# Altium schematic sheet 08 TypeC USB DP.SchDoc
size A3; Revision: V1.2; SheetNumber: 8; SheetTotal: 11
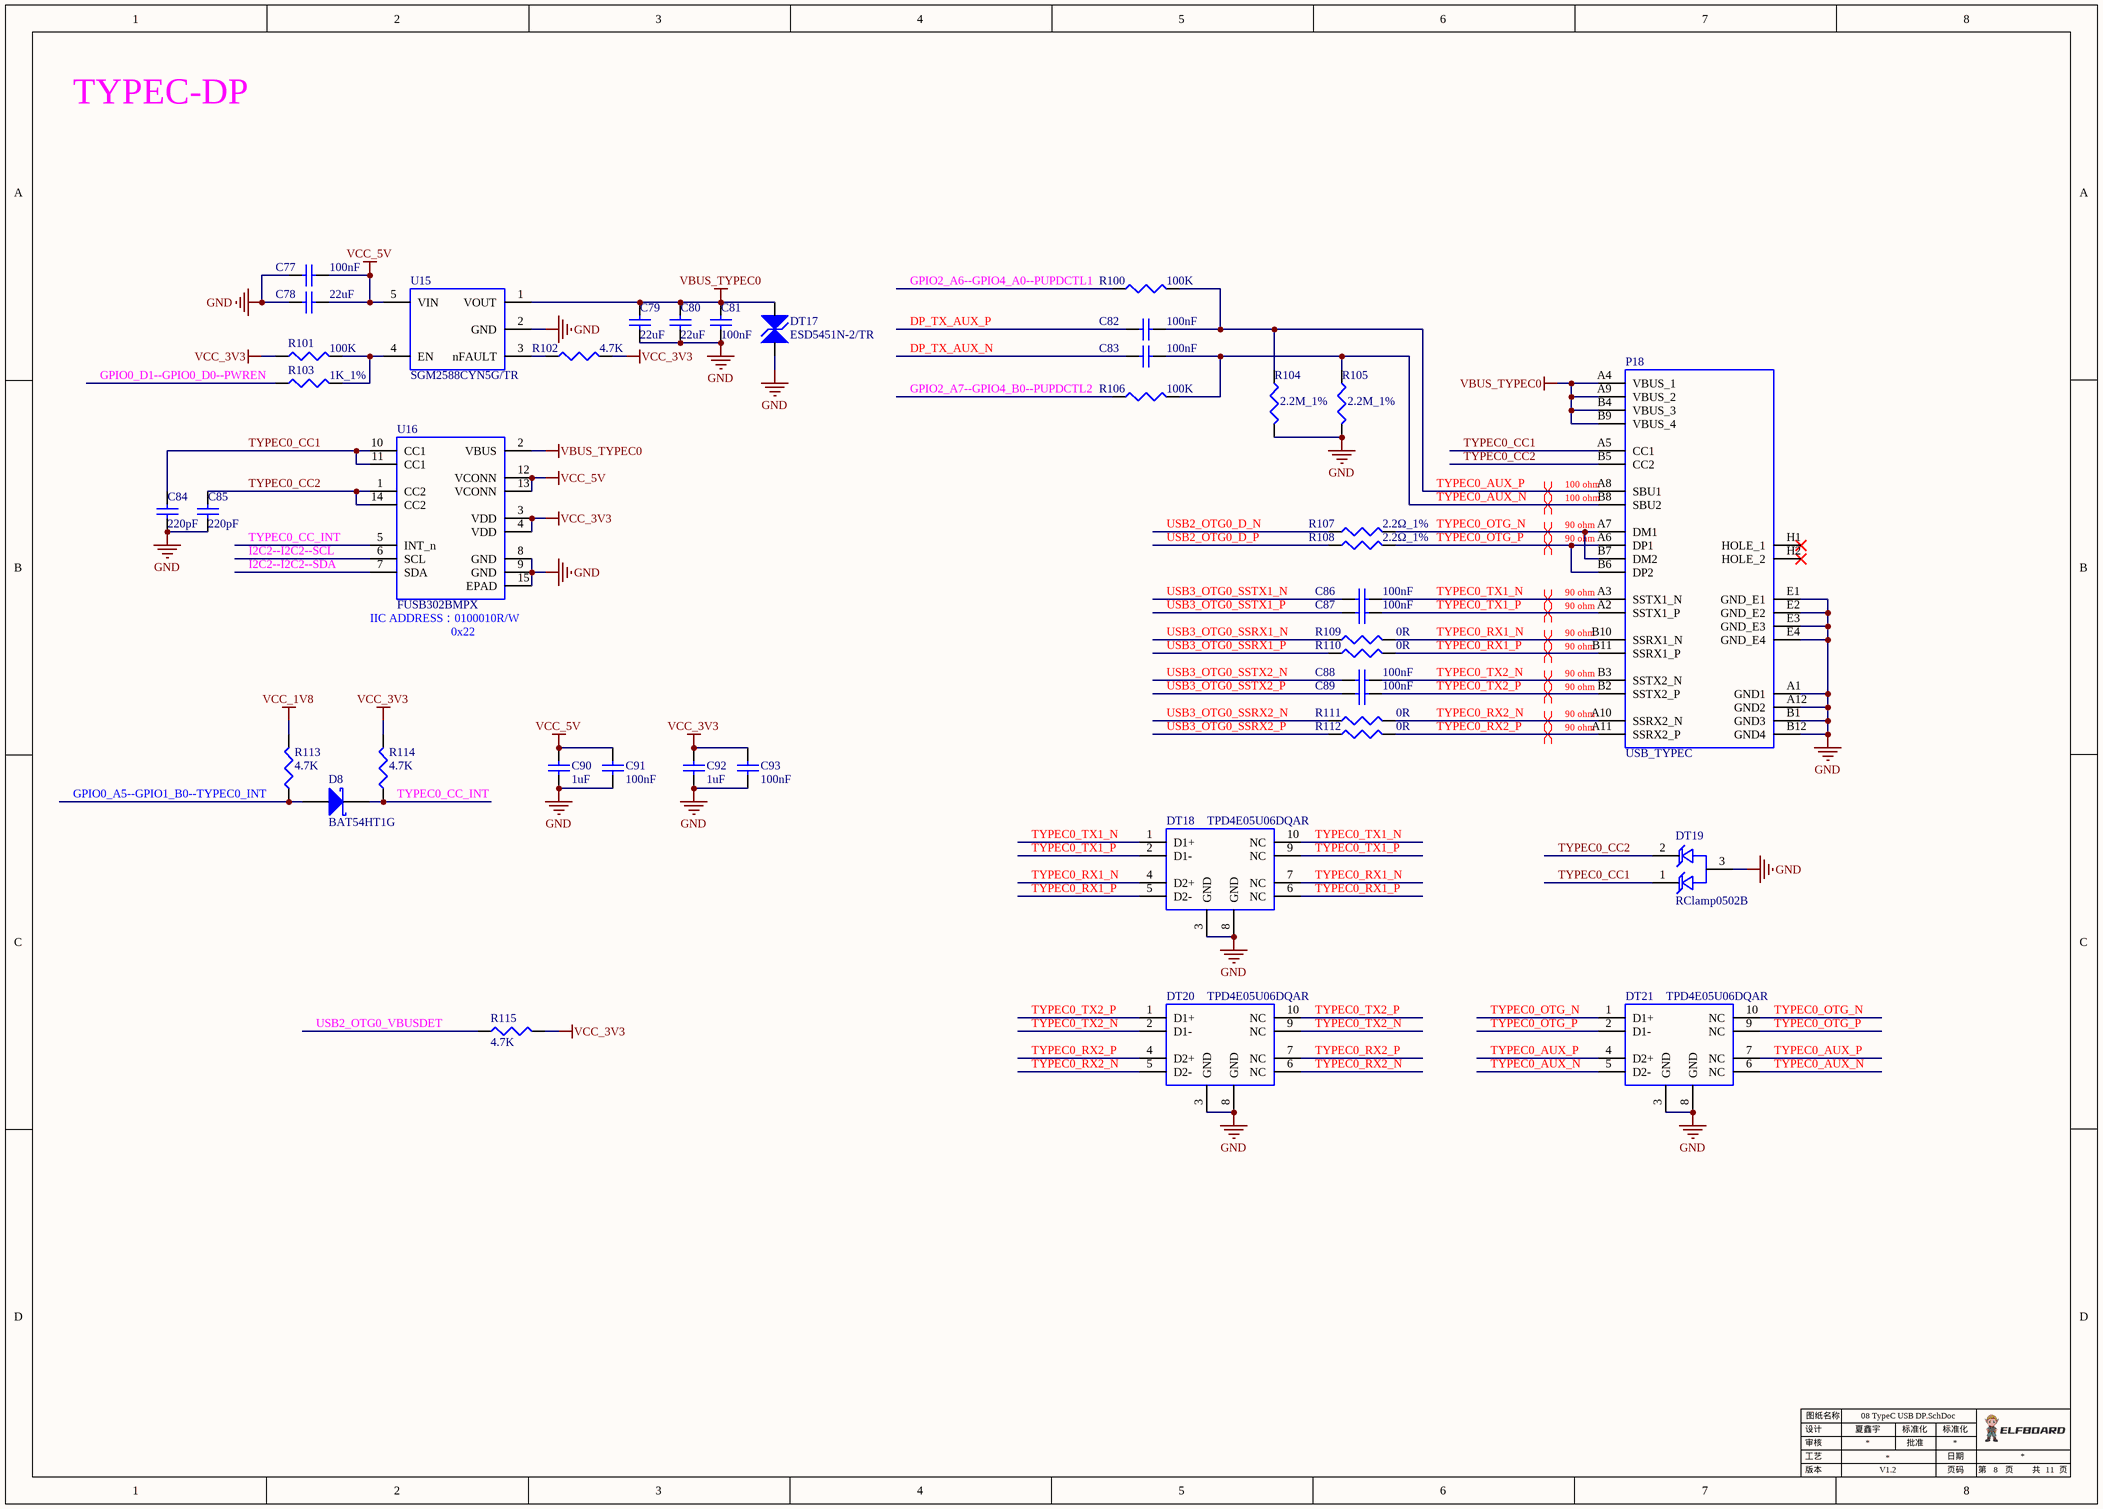
[diagram p0: 08 TypeC USB DP.SchDoc]

## Parts
C77  100nF  [0402C]
C78  22uF  [0805C]
C79  22uF  [0805C]
C80  22uF  [0805C]
C81  100nF  [0402C]
C82  100nF  [0201C]
C83  100nF  [0201C]
C84  220pF  [0402C]
C85  220pF  [0402C]
C86  100nF  [0201C]
C87  100nF  [0201C]
C88  100nF  [0201C]
C89  100nF  [0201C]
C90  1uF  [0402C]
C91  100nF  [0402C]
C92  1uF  [0402C]
C93  100nF  [0402C]
D8  BAT54HT1G  [SOD_323]
DT17  ESD5451N-2/TR  [0402TVS]
DT18  TPD4E05U06DQAR  [USON-10]
DT19  RClamp0502B  [SOT_523]
DT20  TPD4E05U06DQAR  [USON-10]
DT21  TPD4E05U06DQAR  [USON-10]
P18  USB_TYPEC  [USB_TYPEC_SMT]
R100  100K  [0402R]
R101  100K  [0402R]
R102  4.7K  [0402R]
R103  1K_1%  [0402R]
R104  2.2M_1%  [0201R]
R105  2.2M_1%  [0201R]
R106  100K  [0402R]
R107  2.2Ω_1%  [0402R]
R108  2.2Ω_1%  [0402R]
R109  0R  [0201R]
R110  0R  [0201R]
R111  0R  [0201R]
R112  0R  [0201R]
R113  4.7K  [0402R]
R114  4.7K  [0402R]
R115  4.7K  [0402R]
U15  SGM2588CYN5G/TR  [SOT_235]
U16  FUSB302BMPX  [WQFN14_0.5_2.5x2.5]

## Nets
GND: C77.2 C78.2 C79.1 C80.1 C81.1 C84.2 C85.2 C90.1 C91.1 C92.1 C93.1 DT17.1 DT18.3(GND) DT18.8(GND) DT19.3 DT20.3(GND) DT20.8(GND) DT21.3(GND) DT21.8(GND) P18.A1(GND1) P18.A12(GND2) P18.B1(GND3) P18.B12(GND4) P18.E1(GND_E1) P18.E2(GND_E2) P18.E3(GND_E3) P18.E4(GND_E4) R104.2 R105.2 U15.2(GND) U16.8(GND) U16.9(GND) U16.15(EPAD)
VBUS_TYPEC0: C79.2 C80.2 C81.2 DT17.2 P18.A4(VBUS_1) P18.A9(VBUS_2) P18.B4(VBUS_3) P18.B9(VBUS_4) U15.1(VOUT) U16.2(VBUS)
VCC_1V8: R113.2
VCC_3V3: C92.2 C93.2 R101.1 R102.2 R114.2 R115.2 U16.3(VDD) U16.4(VDD)
VCC_5V: C77.1 C78.1 C90.2 C91.2 U15.5(VIN) U16.12(VCONN) U16.13(VCONN)
DP_TX_AUX_N: C83.1
DP_TX_AUX_P: C82.1
GPIO0_A5--GPIO1_B0--TYPEC0_INT: D8.1(A) R113.1
GPIO0_D1--GPIO0_D0--PWREN: R103.1
GPIO2_A6--GPIO4_A0--PUPDCTL1: R100.1
GPIO2_A7--GPIO4_B0--PUPDCTL2: R106.1
I2C2--I2C2--SCL: U16.6(SCL)
I2C2--I2C2--SDA: U16.7(SDA)
TYPEC0_AUX_N: C83.2 DT21.5(D2-) DT21.6(NC) P18.B8(SBU2) R105.1 R106.2
TYPEC0_AUX_P: C82.2 DT21.4(D2+) DT21.7(NC) P18.A8(SBU1) R100.2 R104.1
TYPEC0_CC1: C84.1 DT19.1 P18.A5(CC1) U16.10(CC1) U16.11(CC1)
TYPEC0_CC2: C85.1 DT19.2 P18.B5(CC2) U16.1(CC2) U16.14(CC2)
TYPEC0_CC_INT: D8.2(K) R114.1 U16.5(INT_n)
TYPEC0_OTG_N: DT21.1(D1+) DT21.10(NC) P18.A7(DM1) P18.B7(DM2) R107.2
TYPEC0_OTG_P: DT21.2(D1-) DT21.9(NC) P18.A6(DP1) P18.B6(DP2) R108.2
TYPEC0_RX1_N: DT18.4(D2+) DT18.7(NC) P18.B10(SSRX1_N) R109.2
TYPEC0_RX1_P: DT18.5(D2-) DT18.6(NC) P18.B11(SSRX1_P) R110.2
TYPEC0_RX2_N: DT20.5(D2-) DT20.6(NC) P18.A10(SSRX2_N) R111.2
TYPEC0_RX2_P: DT20.4(D2+) DT20.7(NC) P18.A11(SSRX2_P) R112.2
TYPEC0_TX1_N: C86.2 DT18.1(D1+) DT18.10(NC) P18.A3(SSTX1_N)
TYPEC0_TX1_P: C87.2 DT18.2(D1-) DT18.9(NC) P18.A2(SSTX1_P)
TYPEC0_TX2_N: C88.2 DT20.2(D1-) DT20.9(NC) P18.B3(SSTX2_N)
TYPEC0_TX2_P: C89.2 DT20.1(D1+) DT20.10(NC) P18.B2(SSTX2_P)
USB2_OTG0_D_N: R107.1
USB2_OTG0_D_P: R108.1
USB2_OTG0_VBUSDET: R115.1
USB3_OTG0_SSRX1_N: R109.1
USB3_OTG0_SSRX1_P: R110.1
USB3_OTG0_SSRX2_N: R111.1
USB3_OTG0_SSRX2_P: R112.1
USB3_OTG0_SSTX1_N: C86.1
USB3_OTG0_SSTX1_P: C87.1
USB3_OTG0_SSTX2_N: C88.1
USB3_OTG0_SSTX2_P: C89.1
NetR101_2: R101.2 R103.2 U15.4(EN)
NetR102_1: R102.1 U15.3(nFAULT)

Not connected (* = marked no-connect by the designer): P18 H1(HOLE_1)* H2(HOLE_2)*

## Layout directives
differential pair; differential pair class 90 ohm: TYPEC0_OTG_N, TYPEC0_OTG_P, TYPEC0_RX1_N, TYPEC0_RX1_P, TYPEC0_RX2_N, TYPEC0_RX2_P, TYPEC0_TX1_N, TYPEC0_TX1_P, TYPEC0_TX2_N, TYPEC0_TX2_P
differential pair; differential pair class 100 ohm: TYPEC0_AUX_N, TYPEC0_AUX_P

## Notes on the sheet
- TYPEC-DP
- (near U16) IIC ADDRESS：0100010R/W
- (near U16) 0x22
- 设计
- 审核
- 工艺
- 图纸名称
- 夏鑫宇
- 批准
- 标准化
- 日期
- 版本
- 页码
- 第
- 页
- 共

## Library data of the parts
C77 C81 C91 C93 = 1110202039: 序号: 626; 存货名称: 贴装叠层陶瓷电容; 规格型号: 0402,100nF,25V,±10％,X5R; Published: 8-Jun-2000; LatestRevisionDate: 17-Jul-2002; LatestRevisionNote: Re-released for DXP Platform.; PackageReference: RAD-0.3; Publisher: Altium Limited; PackageDescription: Radial Cap, Thru-Hole; 2 Leads; 0.3 in Pin Spacing; Value: 100nF; 存货编码: 1110202039
C78-C80 = 1110204014: 序号: 751; 存货名称: 贴装叠层陶瓷电容; 规格型号: 0805,22uF,25V,±20％,X5R; Published: 8-Jun-2000; LatestRevisionDate: 17-Jul-2002; LatestRevisionNote: Re-released for DXP Platform.; PackageReference: RAD-0.3; Publisher: Altium Limited; PackageDescription: Radial Cap, Thru-Hole; 2 Leads; 0.3 in Pin Spacing; Value: 22uF; 存货编码: 1110204014
C82 C83 C86-C89 = 1110201009: 存货名称: 贴装叠层陶瓷电容; 规格型号: 0201,100nF,25V,±10％,X5R; Published: 8-Jun-2000; LatestRevisionDate: 17-Jul-2002; LatestRevisionNote: Re-released for DXP Platform.; PackageReference: RAD-0.3; Publisher: Altium Limited; PackageDescription: Radial Cap, Thru-Hole; 2 Leads; 0.3 in Pin Spacing; Value: 100nF; 存货编码: 1110201009
C84 C85 = 1110202017: 序号: 588; 存货名称: 贴装叠层陶瓷电容; 规格型号: 0402,220pF,50V,±10％,X7R; Published: 8-Jun-2000; LatestRevisionDate: 17-Jul-2002; LatestRevisionNote: Re-released for DXP Platform.; PackageReference: RAD-0.3; Publisher: Altium Limited; PackageDescription: Radial Cap, Thru-Hole; 2 Leads; 0.3 in Pin Spacing; Value: 220pF; 存货编码: 1110202017
C90 C92 = 1110202021: 序号: 600; 存货名称: 贴装叠层陶瓷电容; 规格型号: 0402,1uF,16V,±10％,X5R; Published: 8-Jun-2000; LatestRevisionDate: 17-Jul-2002; LatestRevisionNote: Re-released for DXP Platform.; PackageReference: RAD-0.3; Publisher: Altium Limited; PackageDescription: Radial Cap, Thru-Hole; 2 Leads; 0.3 in Pin Spacing; Value: 1uF; 存货编码: 1110202021
D8 = 1110501028: 序号: 2525; 存货名称: 肖特基二极管; 规格型号: BAT54HT1G,SOD323; Published: 8-Jun-2000; LatestRevisionDate: 17-Jul-2002; LatestRevisionNote: Re-released for DXP Platform.; PackageReference: SMB; Publisher: Altium Limited; PackageDescription: DO-214-AA/SMB; 2 C-Bend Leads; Body 5.3 x 3.6 mm, inc. leads (LxW); Code_JEDEC: DO-214-AA; 存货编码: 1110501028; Value: BAT54HT1G
DT17 = 1110503036: 存货名称: TVS管; 规格型号: ESD5451N-2/TR,DFN1006-2L; 禁用状态: 否; Value: ESD5451N-2/TR; 存货编码: 1110503036
DT18 DT20 DT21 = 1110503037: 存货名称: TVS管; 规格型号: TPD4E05U06DQAR,USON; Value: TPD4E05U06DQAR; 存货编码: 1110503037
DT19 = 1110503016: 序号: 2598; 存货名称: TVS管; 规格型号: RCLAMP0502B,SOT-523; Value: RClamp0502B; 存货编码: 1110503016
P18 = 1120102089: 存货名称: 贴装USB座; 规格型号: USB3.0,Type-C,母座,单层,横卧,脚长2mm,雾面,-25~+80℃ TYPEC-507DSW-ACP24F; Value: TYPEC-507DSW-ACP24F; 存货编码: 1120102089
R100 R101 R106 = 1110102004: 序号: 14; 存货名称: 贴装电阻; 规格型号: 0402,100K,±5％; Value: 100K; 存货编码: 1110102004
R102 R113-R115 = 1110102003: 序号: 12; 存货名称: 贴装电阻; 规格型号: 0402,4.7K,±5％; Value: 4.7K; 存货编码: 1110102003
R103 = 1110102011: 序号: 21; 存货名称: 贴装电阻; 规格型号: 0402,1K,±1％; Value: 1K_1%; 存货编码: 1110102011
R104 R105 = 1110101020: 存货名称: 贴装电阻; 规格型号: 0201,2.2M,±1％; Value: 2.2M_1%; 存货编码: 1110101020
R107 R108 = 1110102176: 序号: 196; 存货名称: 贴装电阻; 规格型号: 0402,2.2Ω,±1％; 禁用状态: 否; Value: 2.2Ω_1%; 存货编码: 1110102176
R109-R112 = 1110101001: 序号: 556; 存货名称: 贴装电阻; 规格型号: 0201,0Ω,±5%; Value: 0R; 存货编码: 1110101001
U15 = 1110404183: 序号: 4794; 存货名称: 电源; 规格型号: SGM2588CYN5G/TR,SOT-23-5; 禁用: 否; 近三年购买频次: 近三年购买频次.19; Value: SGM2588CYN5G/TR; 存货编码: 1110404183; 最近一次购买记录: 2025/2/8; 料号建立日期: 2022/10/14
U16 = 1110405272: 存货名称: 常规IC; 规格型号: FUSB302BMPX,WQFN-14; Value: FUSB302BMPX; 存货编码: 1110405272